# Altium schematic sheet STM32G4_mcu.SchDoc
size A4; SheetNumber: 2; SheetTotal: 2
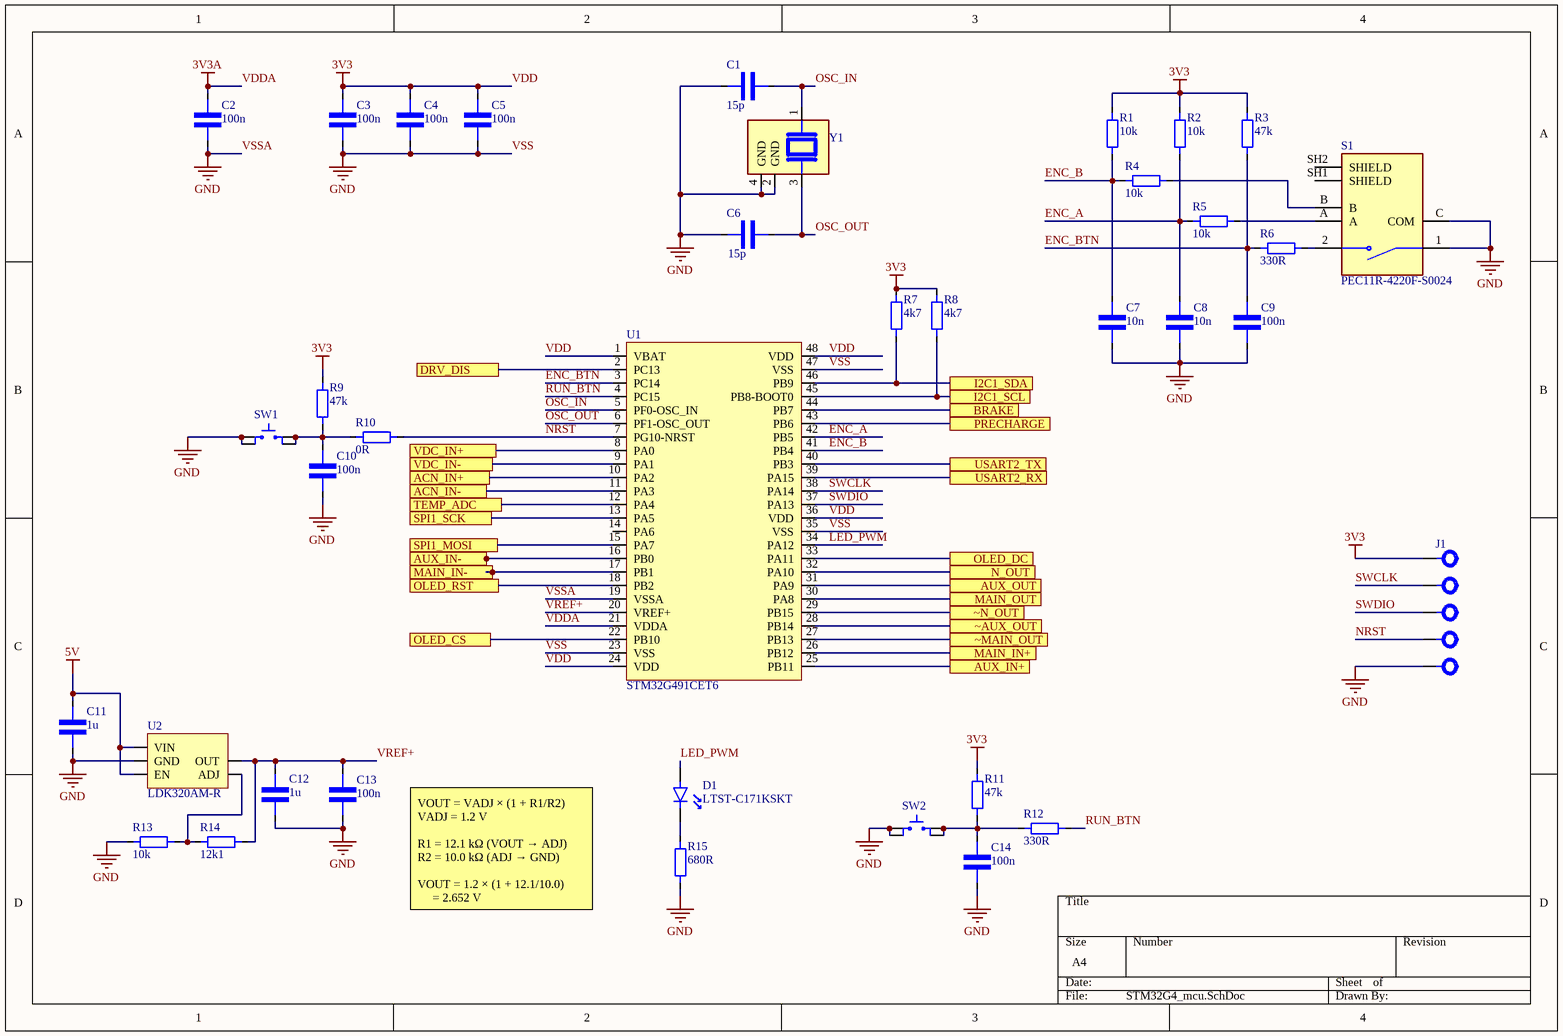
[diagram p0: STM32G4_mcu.SchDoc]

## Parts
C1  15p  [CAPACITOR_0603]
C2  100n  [CAPACITOR_0603]
C3  100n  [CAPACITOR_0603]
C4  100n  [CAPACITOR_0603]
C5  100n  [CAPACITOR_0603]
C6  15p  [CAPACITOR_0603]
C7  10n  [CAPACITOR_0603]
C8  10n  [CAPACITOR_0603]
C9  100n  [CAPACITOR_0603]
C10  100n  [CAPACITOR_0603]
C11  1u  [Capacitor_0805]
C12  1u  [Capacitor_0805]
C13  100n  [CAPACITOR_0603]
C14  100n  [CAPACITOR_0603]
D1  LTST-C171KSKT  [LTST-C171K]
J1  Goldpin_5pin  [Goldpin_5pin]  (value not drawn)
R1  10k  [RESISTOR_0603]
R2  10k  [RESISTOR_0603]
R3  47k  [RESISTOR_0603]
R4  10k  [RESISTOR_0603]
R5  10k  [RESISTOR_0603]
R6  330R  [RESISTOR_0603]
R7  4k7  [RESISTOR_0603]
R8  4k7  [RESISTOR_0603]
R9  47k  [RESISTOR_0603]
R10  0R  [RESISTOR_0603]
R11  47k  [RESISTOR_0603]
R12  330R  [RESISTOR_0603]
R13  10k  [RESISTOR_0603]
R14  12k1  [RESISTOR_0603]
R15  680R  [RESISTOR_0805]
S1  PEC11R-4220F-S0024  [XDCR_PEC11R-4220F-S0024]
SW1  TACT-67N-F  [TACT-67N-F]  (value not drawn)
SW2  TACT-67N-F  [TACT-67N-F]  (value not drawn)
U1  STM32G491CET6  [QFP50P900X900X160-48N]
U2  LDK320AM-R  [LDK320AM-]
Y1  QT532S-8.000MEEQ-T  [XTAL_QT532S-8.000MEEQ-T]  (value not drawn)

## Ports
ACN_IN+, ACN_IN-, AUX_IN+, AUX_IN-, AUX_OUT, BRAKE, DRV_DIS, I2C1_SCL, I2C1_SDA, MAIN_IN+, MAIN_IN-, MAIN_OUT, N_OUT, OLED_CS, OLED_DC, OLED_RST, PRECHARGE, SPI1_MOSI, SPI1_SCK, TEMP_ADC, USART2_RX, USART2_TX, VDC_IN+, VDC_IN-, ~AUX_OUT, ~MAIN_OUT, ~N_OUT

## Nets
5V: C11.2 U2.1(VIN) U2.3(EN)
VDD: C3.2 C4.2 C5.2 J1.1 R1.2 R2.2 R3.2 R7.2 R8.2 R9.2 R11.2 U1.1(VBAT) U1.24(VDD) U1.36(VDD) U1.48(VDD)  [also labelled 3V3]
VDDA: C2.2 U1.21(VDDA)  [also labelled 3V3A]
VSS: C1.1 C2.1 C3.1 C4.1 C5.1 C6.2 C7.1 C8.1 C9.1 C10.1 C11.1 C12.1 C13.1 C14.1 J1.5 R13.1 R15.1 S1.1 S1.C(COM) SW1.1 SW1.2 SW2.1 SW2.2 U1.19(VSSA) U1.23(VSS) U1.35(VSS) U1.47(VSS) U2.2(GND) Y1.2(GND) Y1.4(GND)  [also labelled GND, VSSA]
ACN_IN+: U1.10(PA2) ; port ACN_IN+
ACN_IN-: U1.11(PA3) ; port ACN_IN-
AUX_IN+: U1.25(PB11) ; port AUX_IN+
AUX_IN-: U1.16(PB0) ; port AUX_IN-
AUX_OUT: U1.31(PA9) ; port AUX_OUT
BRAKE: U1.44(PB7) ; port BRAKE
DRV_DIS: U1.2(PC13) ; port DRV_DIS
ENC_A: C8.2 R2.1 R5.2 U1.42(PB5)
ENC_B: C7.2 R1.1 R4.1 U1.41(PB4)
ENC_BTN: C9.2 R3.1 R6.2 U1.3(PC14)
I2C1_SCL: R8.1 U1.45(PB8-BOOT0) ; port I2C1_SCL
I2C1_SDA: R7.1 U1.46(PB9) ; port I2C1_SDA
LED_PWM: D1.1(A) U1.34(PA12)
MAIN_IN+: U1.26(PB12) ; port MAIN_IN+
MAIN_IN-: U1.17(PB1) ; port MAIN_IN-
MAIN_OUT: U1.30(PA8) ; port MAIN_OUT
N_OUT: U1.32(PA10) ; port N_OUT
NRST: J1.4 R10.1 U1.7(PG10-NRST)
OLED_CS: U1.22(PB10) ; port OLED_CS
OLED_DC: U1.33(PA11) ; port OLED_DC
OLED_RST: U1.18(PB2) ; port OLED_RST
OSC_IN: C1.2 U1.5(PF0-OSC_IN) Y1.1
OSC_OUT: C6.1 U1.6(PF1-OSC_OUT) Y1.3
PRECHARGE: U1.43(PB6) ; port PRECHARGE
RUN_BTN: R12.1 U1.4(PC15)
SPI1_MOSI: U1.15(PA7) ; port SPI1_MOSI
SPI1_SCK: U1.13(PA5) ; port SPI1_SCK
SWCLK: J1.2 U1.38(PA14)
SWDIO: J1.3 U1.37(PA13)
TEMP_ADC: U1.12(PA4) ; port TEMP_ADC
USART2_RX: U1.39(PA15) ; port USART2_RX
USART2_TX: U1.40(PB3) ; port USART2_TX
VDC_IN+: U1.8(PA0) ; port VDC_IN+
VDC_IN-: U1.9(PA1) ; port VDC_IN-
VREF+: C12.2 C13.2 R14.2 U1.20(VREF+) U2.5(OUT)
~AUX_OUT: U1.28(PB14) ; port ~AUX_OUT
~MAIN_OUT: U1.27(PB13) ; port ~MAIN_OUT
~N_OUT: U1.29(PB15) ; port ~N_OUT
NetC10_2: C10.2 R9.1 R10.2 SW1.3 SW1.4
NetC14_2: C14.2 R11.1 R12.2 SW2.3 SW2.4
NetD1_2: D1.2(K) R15.2
NetR4_2: R4.2 S1.B
NetR5_1: R5.1 S1.A
NetR6_1: R6.1 S1.2
NetR13_2: R13.2 R14.1 U2.4(ADJ)

Not connected (* = marked no-connect by the designer): S1 SH1(SHIELD) SH2(SHIELD); U1 14(PA6)

## Notes on the sheet
- VOUT = VADJ × (1 + R1/R2)
  VADJ = 1.2 V
  R1 = 12.1 kΩ (VOUT → ADJ)
  R2 = 10.0 kΩ (ADJ → GND)
  VOUT = 1.2 × (1 + 12.1/10.0)
  = 2.652 V

## Library data of the parts
C1-C10 C13 C14 = CAPACITOR_0603: MLCC capacitor in 0603 package
C11 C12 = CAPACITOR_0805: MLCC capacitor in 0805 package
D1 = LTST-C171KSKT: LED; yellow; SMD; 0805; 18÷180mcd; 1.6÷2.4VDC; 2x1.25x0.8mm; 130°
J1 = Goldpin_5pin: Goldpin 5pin connector
R1-R12 = RESISTOR_0603: SMD resistor in 0603 package
R13 R14 = RESISTOR_0603: SMD resistor in 0603 package; Tolerance: 0,1%
R15 = RESISTOR_0805: SMD resistor in 0805 package
S1 = PEC11R-4220F-S0024: MF: {'manufacturer': u'Bourns Inc.'}; Package: None; Price: None; Value: *; MP: PEC11R-4220F-S0024; Availability: Unavailable
SW1 SW2 = TACT-67N-F: Microswitch TACT; SPST-NO; Pos: 2; 0.05A/12VDC; THT; none; 1.6N
U1 = STM32G491CET6: IC: STM32 ARM microcontroller; 170MHz; LQFP48; 1.71÷3.6VDC
U2 = LDK320AM-R: IC: voltage regulator; LDO,linear,adjustable; 1.2÷12V; 0.2A; SMD
Y1 = QT532S-8.000MEEQ-T: 8 MHz Â±10ppm Crystal 10pF 80 Ohms 4-SMD, No Lead; MF: QST PRODUCTS LLC; SnapEDA_Link: https://www.snapeda.com/parts/QT532S-8.000MEEQ-T/QST+PRODUCTS+LLC/view-part/?ref=snap; Package: NON STANDARD-4 QST PRODUCTS LLC; Value: *; MP: QT532S-8.000MEEQ-T; Check_prices: https://www.snapeda.com/parts/QT532S-8.000MEEQ-T/QST+PRODUCTS+LLC/view-part/?ref=eda